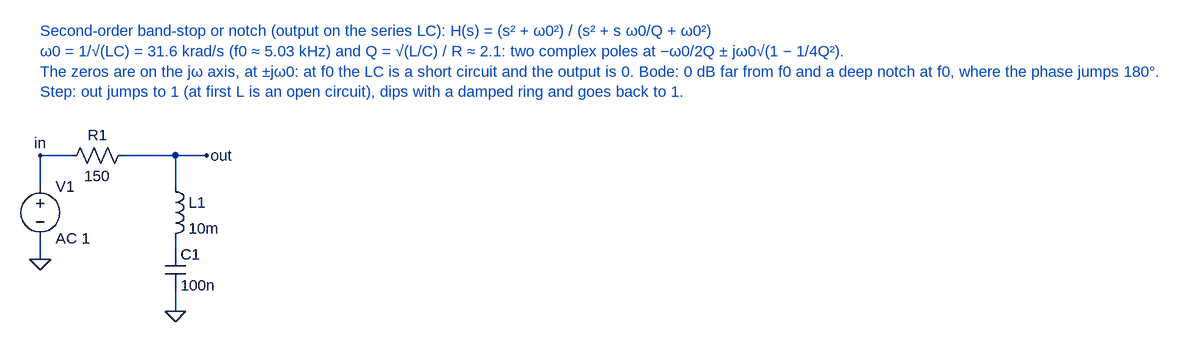
[diagram p0: schematic bs2.asc]
bs2.asc, the LTspice schematic file:
Version 4
SHEET 1 1200 800
WIRE 0 -32 48 -32
WIRE 128 -32 208 -32
WIRE 208 -32 256 -32
WIRE 208 -32 208 16
WIRE 208 96 208 112
WIRE 208 176 208 208
WIRE 0 16 0 -32
WIRE 0 96 0 128
FLAG 208 208 0
FLAG 256 -32 out
FLAG 0 128 0
FLAG 0 -32 in
SYMBOL voltage 0 0 R0
SYMATTR InstName V1
SYMATTR Value AC 1
SYMBOL res 144 -48 R90
WINDOW 0 0 56 VBottom 2
WINDOW 3 32 56 VTop 2
SYMATTR InstName R1
SYMATTR Value 150
SYMBOL ind 192 0 R0
SYMATTR InstName L1
SYMATTR Value 10m
SYMATTR SpiceLine Rser=0
SYMBOL cap 192 112 R0
SYMATTR InstName C1
SYMATTR Value 100n
TEXT 0 -224 Left 2 ;Second-order band-stop or notch (output on the series LC): H(s) = (s² + ω0²) / (s² + s ω0/Q + ω0²)\nω0 = 1/√(LC) = 31.6 krad/s (f0 ≈ 5.03 kHz) and Q = √(L/C) / R ≈ 2.1: two complex poles at −ω0/2Q ± jω0√(1 − 1/4Q²).\nThe zeros are on the jω axis, at ±jω0: at f0 the LC is a short circuit and the output is 0. Bode: 0 dB far from f0 and a deep notch at f0, where the phase jumps 180°.\nStep: out jumps to 1 (at first L is an open circuit), dips with a damped ring and goes back to 1.

The netlist it stands for:
* bs2.asc
V1 in 0 AC 1
R1 out in 150
L1 out N001 10m Rser=0
C1 N001 0 100n
* Second-order band-stop or notch (output on the series LC): H(s) = (s² + ω0²) / (s² + s ω0/Q + ω0²)
* ω0 = 1/√(LC) = 31.6 krad/s (f0 ≈ 5.03 kHz) and Q = √(L/C) / R ≈ 2.1: two complex poles at −ω0/2Q ± jω0√(1 − 1/4Q²).
* The zeros are on the jω axis, at ±jω0: at f0 the LC is a short circuit and the output is 0. Bode: 0 dB far from f0 and a deep notch at f0, where the phase jumps 180°.
* Step: out jumps to 1 (at first L is an open circuit), dips with a damped ring and goes back to 1.
.backanno
.end